# EasyEDA Pro project rp2040 control board.eprj, schematic Schematic1
Create Date: 2023-12-16; Page Name: P1; Project Name: New Project_2023-12-16_15-08-53; Schematic Name: Schematic1; Update Date: 2023-12-17; Company: 嘉立创EDA; Page Size: A4; Version: V1.0
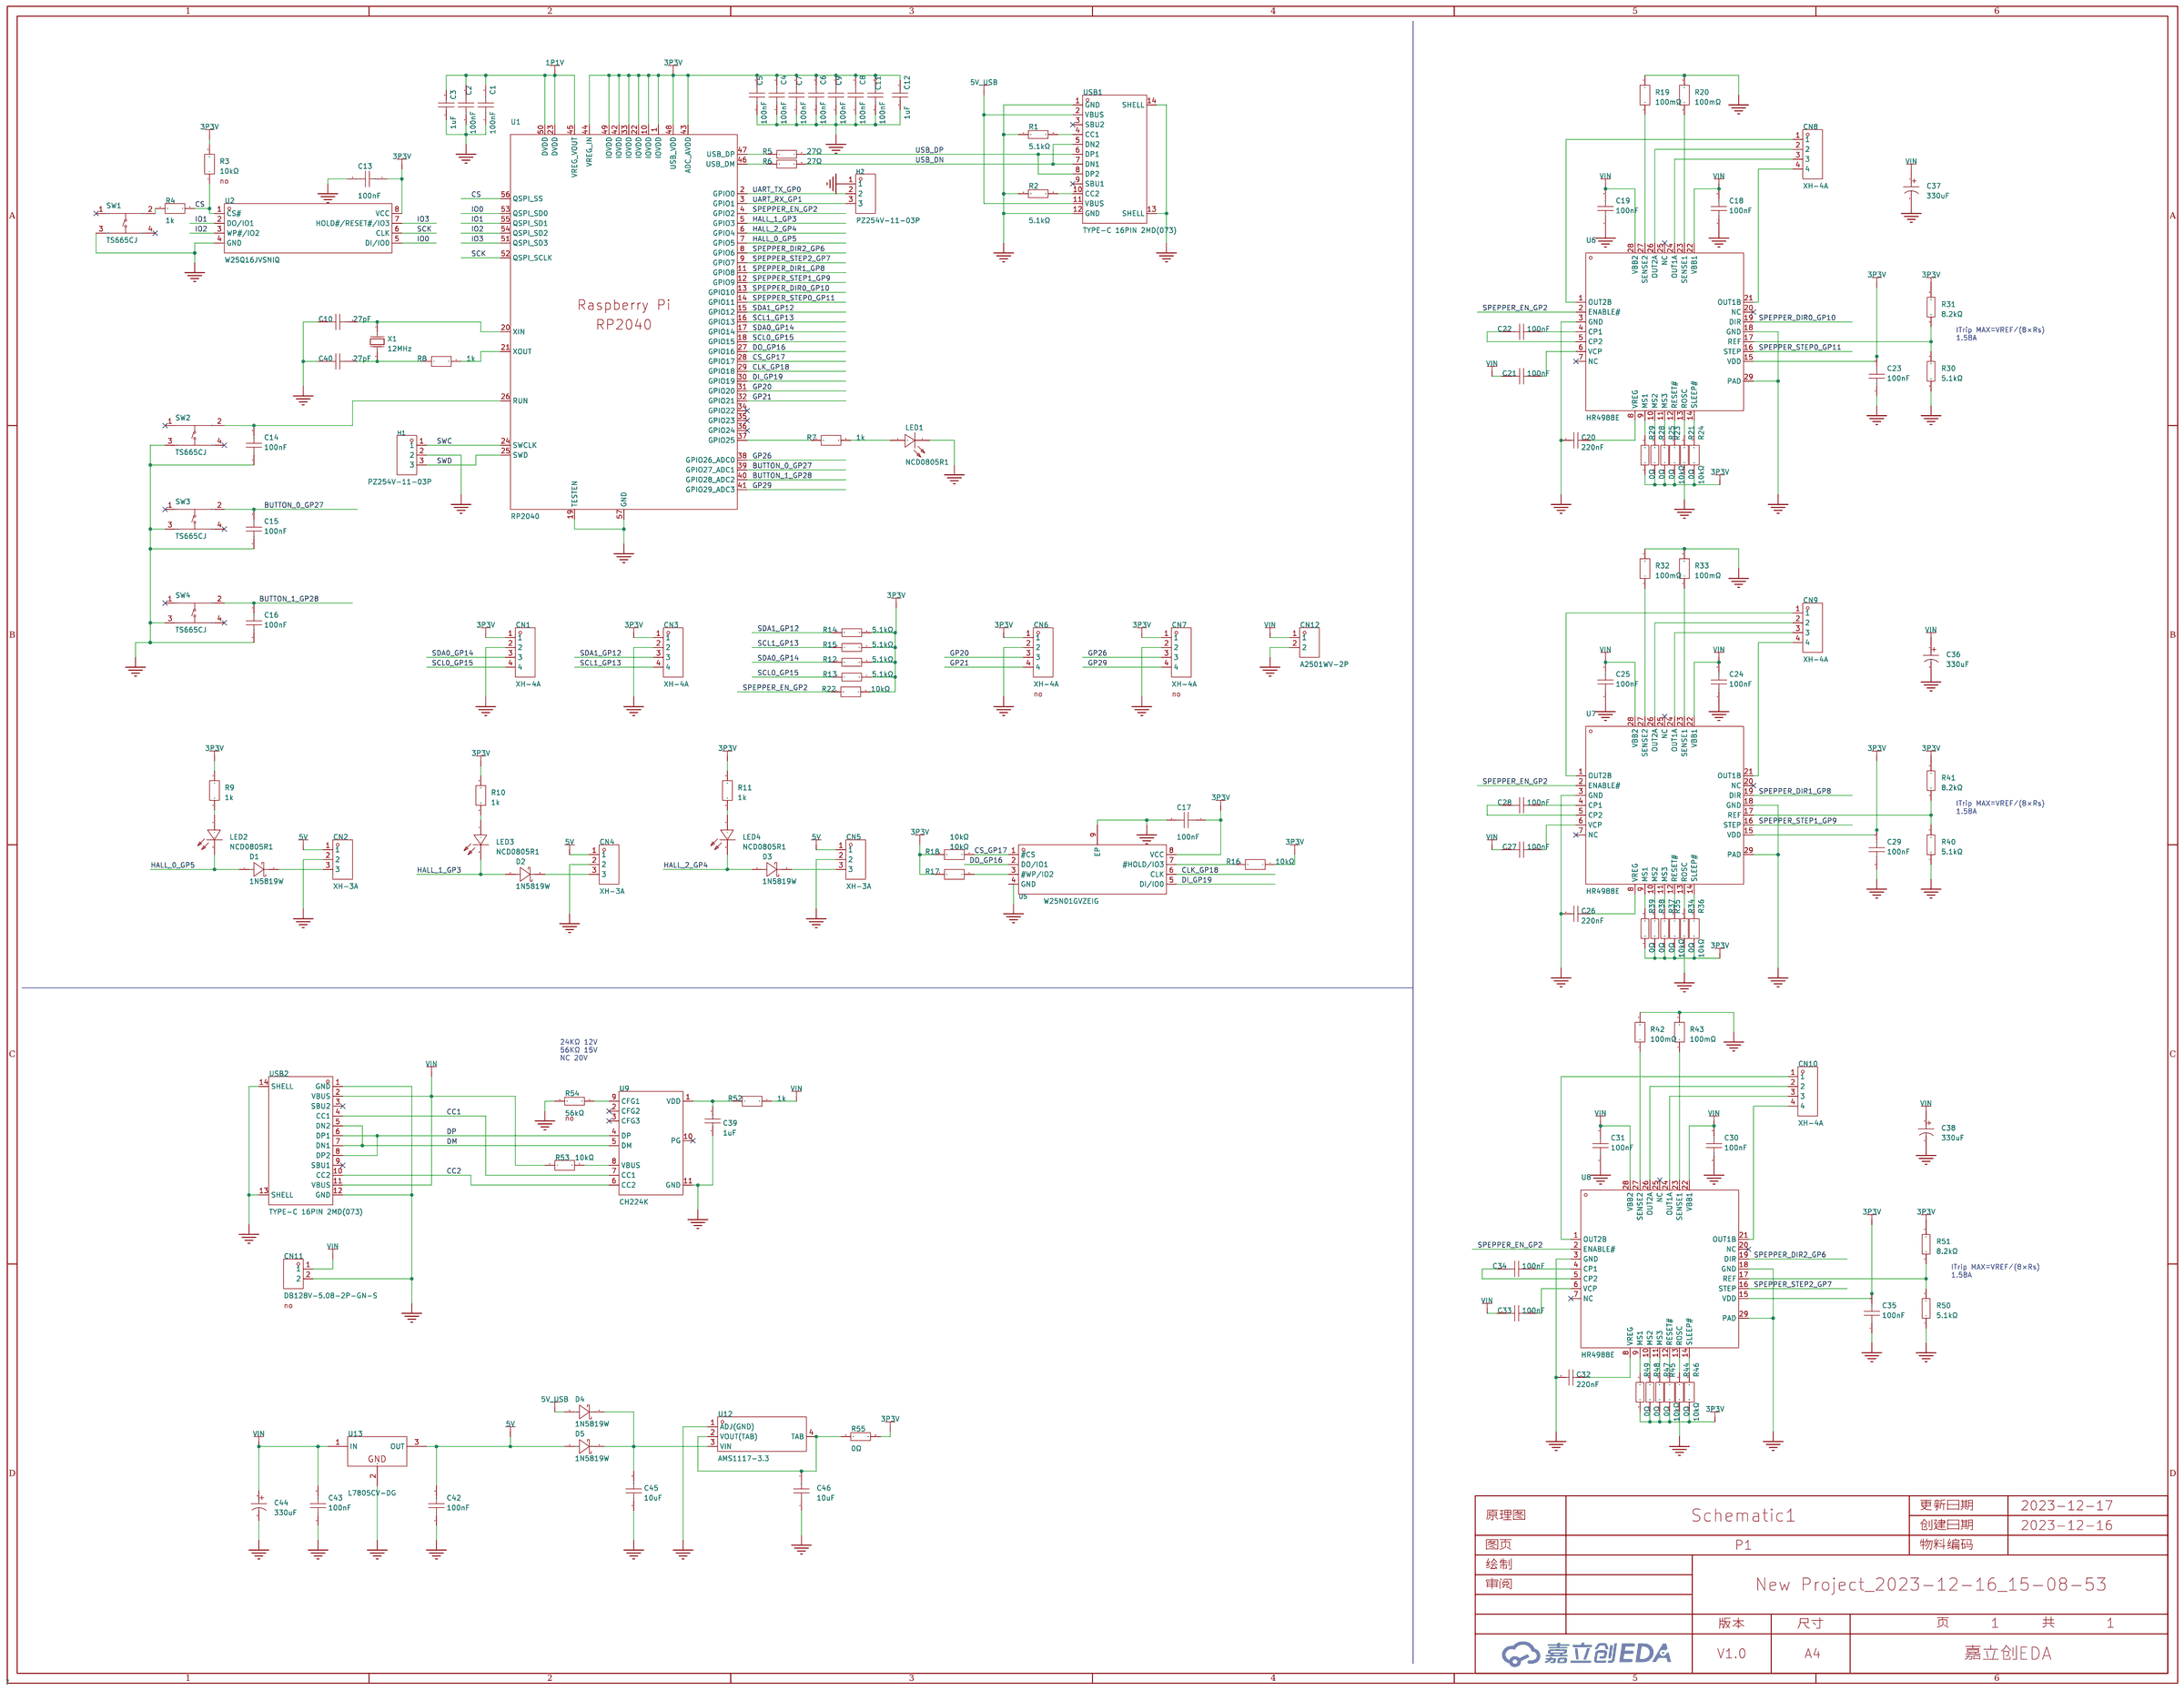
[diagram p0: schematic sheet]

## Parts
C1  100nF  [C0603]
C2  100nF  [C0603]
C3  1uF  [C0603]
C4  100nF  [C0603]
C5  100nF  [C0603]
C6  100nF  [C0603]
C7  100nF  [C0603]
C8  100nF  [C0603]
C9  100nF  [C0603]
C10  27pF  [C0603]
C11  100nF  [C0603]
C12  1uF  [C0603]
C13  100nF  [C0603]
C14  100nF  [C0603]
C15  100nF  [C0603]
C16  100nF  [C0603]
C17  100nF  [C0603]
C18  100nF  [C0603]
C19  100nF  [C0603]
C20  220nF  [C0603]
C21  100nF  [C0603]
C22  100nF  [C0603]
C23  100nF  [C0603]
C24  100nF  [C0603]
C25  100nF  [C0603]
C26  220nF  [C0603]
C27  100nF  [C0603]
C28  100nF  [C0603]
C29  100nF  [C0603]
C30  100nF  [C0603]
C31  100nF  [C0603]
C32  220nF  [C0603]
C33  100nF  [C0603]
C34  100nF  [C0603]
C35  100nF  [C0603]
C36  330uF  [CAP-TH_BD8.0-P3.50-D0.6-FD]
C37  330uF  [CAP-TH_BD8.0-P3.50-D0.6-FD]
C38  330uF  [CAP-TH_BD8.0-P3.50-D0.6-FD]
C39  1uF  [C0603]
C40  27pF  [C0603]
C42  100nF  [C0603]
C43  100nF  [C0603]
C44  330uF  [CAP-TH_BD8.0-P3.50-D0.6-FD]
C45  10uF  [C0603]
C46  10uF  [C0603]
CN1  XH-4A  [CONN-TH_XH2.50-4P]
CN2  XH-3A  [CONN-TH_XH-3A]
CN3  XH-4A  [CONN-TH_XH2.50-4P]
CN4  XH-3A  [CONN-TH_XH-3A]
CN5  XH-3A  [CONN-TH_XH-3A]
CN6  XH-4A  [CONN-TH_XH2.50-4P]  (no BOM)
CN7  XH-4A  [CONN-TH_XH2.50-4P]  (no BOM)
CN8  XH-4A  [CONN-TH_XH2.50-4P]
CN9  XH-4A  [CONN-TH_XH2.50-4P]
CN10  XH-4A  [CONN-TH_XH2.50-4P]
CN11  DB128V-5.08-2P-GN-S  [CONN-TH_2P-P5.08_DIBO_DB128V-5.08]  (no BOM)
CN12  A2501WV-2P  [CONN-TH_A2501WV-2P]
D1  1N5819W  [SOD-123_L2.7-W1.6-LS3.7-R-RD]
D2  1N5819W  [SOD-123_L2.7-W1.6-LS3.7-R-RD]
D3  1N5819W  [SOD-123_L2.7-W1.6-LS3.7-R-RD]
D4  1N5819W  [SOD-123_L2.7-W1.6-LS3.7-R-RD]
D5  1N5819W  [SOD-123_L2.7-W1.6-LS3.7-R-RD]
H1  PZ254V-11-03P  [HDR-TH_3P-P2.54-V-M]
H2  PZ254V-11-03P  [HDR-TH_3P-P2.54-V-M]
LED1  NCD0805R1  [LED0805-R-RD]
LED2  NCD0805R1  [LED0805-R-RD]
LED3  NCD0805R1  [LED0805-R-RD]
LED4  NCD0805R1  [LED0805-R-RD]
R1  5.1kΩ  [R0603]
R2  5.1kΩ  [R0603]
R3  10kΩ  [R0603]  (no BOM)
R4  1k  [R0603]
R5  27Ω  [R0603]
R6  27Ω  [R0603]
R7  1k  [R0603]
R8  1k  [R0603]
R9  1k  [R0603]
R10  1k  [R0603]
R11  1k  [R0603]
R12  5.1kΩ  [R0603]
R13  5.1kΩ  [R0603]
R14  5.1kΩ  [R0603]
R15  5.1kΩ  [R0603]
R16  10kΩ  [R0603]
R17  10kΩ  [R0603]
R18  10kΩ  [R0603]
R19  100mΩ  [R0805]
R20  100mΩ  [R0805]
R21  0Ω  [R0603]
R22  10kΩ  [R0603]
R23  10kΩ  [R0603]
R24  10kΩ  [R0603]
R25  0Ω  [R0603]
R28  0Ω  [R0603]
R29  0Ω  [R0603]
R30  5.1kΩ  [R0603]
R31  8.2kΩ  [R0603]
R32  100mΩ  [R0805]
R33  100mΩ  [R0805]
R34  0Ω  [R0603]
R35  10kΩ  [R0603]
R36  10kΩ  [R0603]
R37  0Ω  [R0603]
R38  0Ω  [R0603]
R39  0Ω  [R0603]
R40  5.1kΩ  [R0603]
R41  8.2kΩ  [R0603]
R42  100mΩ  [R0805]
R43  100mΩ  [R0805]
R44  0Ω  [R0603]
R45  10kΩ  [R0603]
R46  10kΩ  [R0603]
R47  0Ω  [R0603]
R48  0Ω  [R0603]
R49  0Ω  [R0603]
R50  5.1kΩ  [R0603]
R51  8.2kΩ  [R0603]
R52  1k  [R0603]
R53  10kΩ  [R0603]
R54  56kΩ  [R0603]  (no BOM)
R55  0Ω  [R0603]
SW1  TS665CJ  [SW-TH_4P-L6.0-W6.0-P4.50-LS6.5]
SW2  TS665CJ  [SW-TH_4P-L6.0-W6.0-P4.50-LS6.5]
SW3  TS665CJ  [SW-TH_4P-L6.0-W6.0-P4.50-LS6.5]
SW4  TS665CJ  [SW-TH_4P-L6.0-W6.0-P4.50-LS6.5]
U1  RP2040  [LQFN-56_L7.0-W7.0-P0.4-EP]
U2  W25Q16JVSNIQ  [SOP-8_L4.9-W3.9-P1.27-LS6.0-BL]
U5  W25N01GVZEIG  [WSON-8_L8.0-W6.10-P1.27-TL-EP]
U6  HR4988E  [QFN-28_L5.0-W5.0-P0.50-BL-EP3.3]
U7  HR4988E  [QFN-28_L5.0-W5.0-P0.50-BL-EP3.3]
U8  HR4988E  [QFN-28_L5.0-W5.0-P0.50-BL-EP3.3]
U9  CH224K  [ESSOP-10_L4.9-W3.9-P1.0-LS6.0-TL-EP]
U12  AMS1117-3.3  [SOT-223-4_L6.5-W3.5-P2.30-LS7.0-BR]
U13  L7805CV-DG  [TO-220-3_L10.0-W4.5-P2.54-L]
USB1  TYPE-C 16PIN 2MD(073)  [USB-C-SMD_TYPE-C-6PIN-2MD-073]
USB2  TYPE-C 16PIN 2MD(073)  [USB-C-SMD_TYPE-C-6PIN-2MD-073]
X1  12MHz  [HC-49US_L11.5-W4.5-P4.88]

## Library data of the parts
C1 C2 C4-C9 C11 C13-C19 C21-C25 C27-C31 C33-C35 C42 C43 = CC0603KRX7R9BB104: 容值:100nF;精度:±10%;额定电压:50V;材质(温度系数):X7R;; LCSC Part Name: 100nF ±10% 50V; Supplier Part: C14663; Manufacturer: YAGEO(国巨); Supplier Footprint: 0603; Datasheet: https://atta.szlcsc.com/upload/public/pdf/source/20180910/C282072_33301C7F631E79921B82A8DAC6BCC5B3.pdf; Supplier: LCSC; Tolerance: ±10%; Voltage Rated: 50V; Temperature Coefficient: X7R
C3 C12 C39 = CL10A105KB8NNNC: 容值:1uF;精度:±10%;额定电压:50V;材质(温度系数):X5R;; LCSC Part Name: 1uF ±10% 50V; Supplier Part: C15849; Manufacturer: SAMSUNG(三星); Supplier Footprint: 0603; Datasheet: https://atta.szlcsc.com/upload/public/pdf/source/20160218/1457707763339.pdf; Supplier: LCSC; Tolerance: ±10%; Voltage Rated: 50V; Temperature Coefficient: X5R
C10 C40 = CGA3E2C0G2A270J080AA: 容值:27pF;精度:±5%;额定电压:100V;材质(温度系数):C0G;; LCSC Part Name: 27pF ±5% 100V; Supplier Part: C3862781; Manufacturer: TDK; JLCPCB Part Class: 扩展库; Supplier: LCSC; Tolerance: ±5%; Voltage Rated: 100V; Temperature Coefficient: C0G
C20 C26 C32 = CL10B224KA8NNNC: 容值:220nF;精度:±10%;额定电压:25V;材质(温度系数):X7R;; LCSC Part Name: 220nF ±10% 25V; Supplier Part: C21120; Manufacturer: SAMSUNG(三星); Supplier Footprint: 0603; JLCPCB Part Class: 基础库; Datasheet: https://atta.szlcsc.com/upload/public/pdf/source/20160218/1457707763339.pdf; Supplier: LCSC; Tolerance: ±10%; Voltage Rated: 25V; Temperature Coefficient: X7R
C36-C38 C44 = 25ZLH330MEFC8X11.5: 容值:330uF;精度:±20%;额定电压:25V;纹波电流:945mA@100kHz;等效串联电阻:56mΩ@100kHz;; LCSC Part Name: 330uF ±20% 25V; Supplier Part: C109394; Manufacturer: rubycon(红宝石); Supplier Footprint: 插件,D8xL11.5mm; JLCPCB Part Class: 扩展库; Datasheet: https://atta.szlcsc.com/upload/public/pdf/source/20180704/C239301_0BE3E23B004BE37AFF30B8978A226056.pdf; Supplier: LCSC; Tolerance: ±20%; Rated Voltage: 25V; Ripple Current: 945mA@100kHz; Equivalent Series Resistance(ESR): 56mΩ@100kHz; Lead Spacing: 3.5mm; φD: 8mm; L: 11.5mm; Lifetime @ Temp: 8000hrs@105℃; Operating Temperature: -40℃~+105℃
C45 C46 = CL10A106KP8NNNC: 容值:10uF;精度:±10%;额定电压:10V;材质(温度系数):X5R;; LCSC Part Name: 10uF ±10% 10V; Supplier Part: C19702; Manufacturer: SAMSUNG(三星); Supplier Footprint: 0603; JLCPCB Part Class: 基础库; Datasheet: https://atta.szlcsc.com/upload/public/pdf/source/20160218/1457707763339.pdf; Supplier: LCSC; Tolerance: ±10%; Voltage Rated: 10V; Temperature Coefficient: X5R
CN1 CN3 CN6-CN10 = XH-4A_C2908602: 插针结构:1x4P;间距:2.5mm;安装方式:直插;行距:-;总PIN数:4P;排数:1;每排PIN数:4;参考系列:XH;额定电流:3A;工作温度范围:-25℃~+85℃;; LCSC Part Name: 1x4P 间距:2.5mm 直插 系列:XH; Supplier Part: C2908602; Manufacturer: HCTL(华灿天禄); Supplier Footprint: 插件,P=2.5mm; JLCPCB Part Class: 扩展库; Datasheet: https://atta.szlcsc.com/upload/public/pdf/source/20230711/68D365716984B4AFE576D1D73D61B465.pdf; Supplier: LCSC; Pins Structure: 1x4P; Pitch: 2.5mm; Mounting Style: 直插; Number of Pins: 4P; Number of Rows: 1; Number of PINs Per Row: 4; Reference Series: XH; Current Rating (Max): 3A; Operating Temperature Range: -25℃~+85℃
CN2 CN4 CN5 = XH-3A: 插针结构:1x3P;间距:2.5mm;安装方式:直插;行距:-;总PIN数:3P;排数:1;每排PIN数:3;参考系列:XH;额定电流:3A;工作温度范围:-25℃~+85℃;; LCSC Part Name: 1x3P 间距:2.5mm 直插 系列:XH; Supplier Part: C2908601; Manufacturer: HCTL(华灿天禄); Supplier Footprint: 插件,P=2.5mm; JLCPCB Part Class: Extended Part; Datasheet: https://atta.szlcsc.com/upload/public/pdf/source/20230711/68D365716984B4AFE576D1D73D61B465.pdf; Supplier: LCSC; Pins Structure: 1x3P; Pitch: 2.5mm; Mounting Style: 直插; Number of Pins: 3P; Number of Rows: 1; Number of PINs Per Row: 3; Reference Series: XH; Current Rating (Max): 3A; Operating Temperature Range: -25℃~+85℃
CN11 = DB128V-5.08-2P-GN-S: 间距:5.08mm;结构:1x2P;安装方式:直插;排数:1;额定电流:20A;额定电压:300V;线规 - AWG:12~30;线规 - mm2:2.5;工作温度范围:-40℃~+105℃;颜色:绿色;每排PIN数:2;; LCSC Part Name: 5.08mm 1x2P 排数:1 每排P数:2 直插 铜; Supplier Part: C2915639; Manufacturer: DORABO(地博电气); Supplier Footprint: 插件,P=5.08mm; JLCPCB Part Class: 扩展库; Datasheet: https://atta.szlcsc.com/upload/public/pdf/source/20230106/CC449C10514519CDCE20F1C37DBF2DAC.pdf; Supplier: LCSC; Pitch: 5.08mm; Structure: 1x2P; Mounting Style: 直插; Number of Pins: 2P; Number of Rows: 1; Current Rating (Max): 20A; Voltage Rating (Max): 300V; Wire Gauge - AWG: 12~30; Wire Gauge - mm2: 2.5; Operating Temperature Range: -40℃~+105℃; Color: 绿色; Number of PINs Per Row: 2
CN12 = A2501WV-2P: 插针结构:1x2P;间距:2.5mm;安装方式:-;行距:-;总PIN数:2P;排数:1;每排PIN数:2;参考系列:XH;触头材质:黄铜;; LCSC Part Name: 1x2P 间距:2.5mm 系列:XH 直插 镀锡; Supplier Part: C225388; Manufacturer: CJT(长江连接器); Supplier Footprint: 插件,P=2.5mm; JLCPCB Part Class: 扩展库; Datasheet: https://atta.szlcsc.com/upload/public/pdf/source/20190911/C273207_AE7733CA28D6B2C9AC656CEED013742F.pdf; Supplier: LCSC; Pins Structure: 1x2P; Pitch: 2.5mm; Number of Pins: 2P; Number of Rows: 1; Number of PINs Per Row: 2; Reference Series: XH; Contact Material: 黄铜
D1-D5 = 1N5819W_C963381: 二极管配置:独立式;正向压降(Vf):600mV@200mA;直流反向耐压(Vr):40V;平均整流电流(Io):350mA;; LCSC Part Name: 电压:40V 电流:350mA; Supplier Part: C963381; Manufacturer: JSMSEMI(杰盛微); Supplier Footprint: SOD-123; JLCPCB Part Class: 扩展库; Datasheet: https://atta.szlcsc.com/upload/public/pdf/source/20230807/ADD53622154D5B572F84A7B877E922CE.pdf; Supplier: LCSC; Diode Configuration: 独立式; Forward Voltage (Vf@If): 600mV@200mA; Reverse Voltage (Vr): 40V; Average Rectified Current (Io): 350mA; Reverse Leakage Current (Ir): 5uA@30V
H1 H2 = PZ254V-11-03P: 排数:单排;总PIN位数:3;间距:2.54mm;插针结构:1x3P;行距:-;安装类型:直插;圆针/方针:方针;额定电流:3A;额定电压:250V;配合针长度:6mm;塑高:2.5mm;端接针长度:3mm;工作温度范围:-40℃~+105℃;颜色:黑色;; LCSC Part Name: 2.54mm 1x3P 直插 方针; Supplier Part: C2937625; Manufacturer: XFCN(兴飞); Supplier Footprint: 直插,P=2.54mm; JLCPCB Part Class: 扩展库; Datasheet: 2022-07-12/581362A/62b9d00620994b3696be7eb4af85ad72/双排排针和单排排针.pdf; Supplier: LCSC; Number of Rows: 单排; Number of Pins: 3; Pitch: 2.54mm; Pin Structure: 1x3P; Mounting Type: 直插; Circluar Pins/Square Pins: 方针; Current Rating (Max): 3A; Voltage Rating (Max): 250V; Length of Mating Pin: 6mm; Insulation Height: 2.5mm; Length of End Connection Pin: 3mm; Operating Temperature Range: -40℃~+105℃; Color: 黑色
LED1-LED4 = NCD0805R1: 发光颜色:红色;二极管配置:-;功率:65mW;透镜颜色:无色透明;主波长:615nm~630nm;色温:-;发光强度:67mcd~195mcd;发光角度:130°;安装方式:-;工作温度:-30℃~+85℃;; LCSC Part Name: 红灯 0805红灯   正贴; Supplier Part: C84256; Manufacturer: 国星光电; Supplier Footprint: 0805; JLCPCB Part Class: 基础库; Datasheet: https://atta.szlcsc.com/upload/public/pdf/source/20200820/C84256_F0A75A43B3EAD75808600A0514C76B99.pdf; Supplier: LCSC; Emitted Color: 红色; Forward Voltage (VF): 1.6V~2.6V; Forward Current: 20mA; Power Dissipation: 65mW; Lens Color: 无色透明; Dominant Wavelength: 615nm~630nm; Luminous Intensity: 67mcd~195mcd; Viewing Angle: 130°; Operating Temperature: -30℃~+85℃
R1 R2 R12-R15 R30 R40 R50 = 0603WAF5101T5E: 阻值:5.1kΩ;精度:±1%;功率:100mW;温度系数:±100ppm/℃;电阻类型:厚膜电阻;; LCSC Part Name: 5.1kΩ ±1% 100mW 厚膜电阻; Supplier Part: C23186; Manufacturer: UNI-ROYAL(厚声); Supplier Footprint: 0603; Datasheet: https://atta.szlcsc.com/upload/public/pdf/source/20200306/C422600_1E6D84923E4A46A82E41ADD87F860B5C.pdf; Supplier: LCSC; Tolerance: ±1%; Power(Watts): 100mW; Overload Voltage (Max): 75V; Temperature Coefficient: ±100ppm/℃; Type: 厚膜电阻; Operating Temperature Range: -55℃~+155℃
R3 R16-R18 R22-R24 R35 R36 R45 R46 R53 = AT0603BRD0710KL: 电阻类型:薄膜电阻;阻值:10kΩ;精度:±0.1%;功率:100mW;; LCSC Part Name: 10kΩ ±0.1% 100mW; Supplier Part: C723396; Manufacturer: YAGEO(国巨); Supplier Footprint: 0603; JLCPCB Part Class: 扩展库; Datasheet: https://atta.szlcsc.com/upload/public/pdf/source/20200722/C705051_EA338A836C78FCD1C867566BE6F43B3A.pdf; Supplier: LCSC; Type: 薄膜电阻; Tolerance: ±0.1%; Power(Watts): 100mW; Temperature Coefficient: ±25ppm/℃; Overload Voltage (Max): 75V; Operating Temperature Range: -55℃~+155℃
R4 R7-R11 R52 = 1k: Supplier Part: C9900012840; JLCPCB Part Class: 扩展库; Supplier: LCSC
R5 R6 = RS-03K27R0FT: 精度:±1%;温度系数:±100ppm/℃;阻值:27Ω;功率:100mW;最大工作电压:50V;工作温度范围:-55℃~+155℃;; LCSC Part Name: 27.0Ω(27R0) ±1%; Supplier Part: C321830; Manufacturer: FH(风华); Supplier Footprint: 0603; JLCPCB Part Class: 扩展库; Datasheet: https://atta.szlcsc.com/upload/public/pdf/source/20181120/C321830_E77A57045CE9A79D257E73FE3C106617.pdf; Supplier: LCSC; Tolerance: ±1%; Temperature Coefficient: ±100ppm/℃; Power(Watts): 100mW; Overload Voltage (Max): 50V; Operating Temperature Range: -55℃~+155℃
R19 R20 R32 R33 R42 R43 = CR0805J0R1P05: 电阻类型:厚膜电阻;阻值:100mΩ;精度:±5%;功率:125mW;; LCSC Part Name: 100mΩ ±5% 125mW; Supplier Part: C429643; Manufacturer: EVER OHMS(天二科技); Supplier Footprint: 0805; JLCPCB Part Class: 扩展库; Datasheet: https://atta.szlcsc.com/upload/public/pdf/source/20190918/C429643_B0DBD6D3E4412DC6138E94FA6C8BEFE1.pdf; Supplier: LCSC; Type: 厚膜电阻; Tolerance: ±5%; Power(Watts): 125mW; Temperature Coefficient: ±800ppm/℃; Overload Voltage (Max): 150V; Operating Temperature Range: -55℃~+155℃
R21 R25 R28 R29 R34 R37-R39 R44 R47-R49 R55 = 0603WAF0000T5E: 阻值:0Ω;精度:±1%;功率:100mW;电阻类型:厚膜电阻;; LCSC Part Name: 0Ω ±1% 100mW 厚膜电阻; Supplier Part: C21189; Manufacturer: UNI-ROYAL(厚声); Supplier Footprint: 0603; JLCPCB Part Class: 基础库; Datasheet: https://atta.szlcsc.com/upload/public/pdf/source/20200306/C422600_1E6D84923E4A46A82E41ADD87F860B5C.pdf; Supplier: LCSC; Tolerance: ±1%; Power(Watts): 100mW; Overload Voltage (Max): 75V; Type: 厚膜电阻; Operating Temperature Range: -55℃~+155℃
R31 R41 R51 = 0603WAF8201T5E: 阻值:8.2kΩ;精度:±1%;功率:100mW;温度系数:±100ppm/℃;电阻类型:厚膜电阻;; LCSC Part Name: 8.2kΩ ±1% 100mW 厚膜电阻; Supplier Part: C25981; Manufacturer: UNI-ROYAL(厚声); Supplier Footprint: 0603; Datasheet: https://atta.szlcsc.com/upload/public/pdf/source/20200306/C422600_1E6D84923E4A46A82E41ADD87F860B5C.pdf; Supplier: LCSC; Tolerance: ±1%; Power(Watts): 100mW; Overload Voltage (Max): 75V; Temperature Coefficient: ±100ppm/℃; Type: 厚膜电阻; Operating Temperature Range: -55℃~+155℃
R54 = 0603WAF5602T5E: 阻值:56kΩ;精度:±1%;功率:100mW;温度系数:±100ppm/℃;电阻类型:厚膜电阻;; LCSC Part Name: 56kΩ ±1% 100mW 厚膜电阻; Supplier Part: C23206; Manufacturer: UNI-ROYAL(厚声); Supplier Footprint: 0603; JLCPCB Part Class: 基础库; Datasheet: https://atta.szlcsc.com/upload/public/pdf/source/20200306/C422600_1E6D84923E4A46A82E41ADD87F860B5C.pdf; Supplier: LCSC; Tolerance: ±1%; Power(Watts): 100mW; Overload Voltage (Max): 75V; Temperature Coefficient: ±100ppm/℃; Type: 厚膜电阻; Operating Temperature Range: -55℃~+155℃
SW1-SW4 = TS665CJ: 触点电流:50mA;额定电压(DC):12V;电路结构:单刀单掷;安装方式:直插;带灯:-;机械寿命:-;; LCSC Part Name: 6*6*5mm 直插 轻触开关; Supplier Part: C393938; Manufacturer: SHOU HAN(首韩); Supplier Footprint: 插件; JLCPCB Part Class: 扩展库; Datasheet: https://atta.szlcsc.com/upload/public/pdf/source/20190521/C393938_BDABEAC600B4C55E200A80AA129B70BC.pdf; Supplier: LCSC; Contact Current: 50mA; Voltage Rating (DC): 12V; Circuit: 单刀单掷; Mounting Style: 直插; Actuator Style: 圆形按钮; Switch Length: 6mm; Switch Width: 6mm; Switch Height: 5mm
U1 = RP2040_C2040: CPU内核:ARM-M系列;CPU最大主频:133MHz;程序存储容量:-;程序存储器类型:-;GPIO端口数量:30;工作电压范围:-;RAM总容量:264KB;应用领域:-;; Supplier Part: C2040; Manufacturer: Raspberry Pi(树莓派); Supplier Footprint: LQFN-56(7x7); Datasheet: https://atta.szlcsc.com/upload/public/pdf/source/20210621/C2040_96F425825606B7957D87DD32E2512CA9.pdf; Supplier: LCSC; CPU Core: ARM-M系列; CPU Maximum Speed: 133MHz; GPIO Ports Number: 30; RAM Size: 264KB; ADC (Bit): 12bit; UART/USART: 2; I2C: 2; SPI: 2; Universal Serial Bus: 有; Peripheral/Function: DMA；PWM; Direct Memory Access: 有
U2 = W25Q16JVSNIQ_C2456211: Supplier Part: C2456211; Manufacturer: WINBOND(华邦); Supplier Footprint: SOP-8; JLCPCB Part Class: 扩展库; Datasheet: https://atta.szlcsc.com/upload/public/pdf/source/20190529/C115407_78E5B4F96E7138D299EC51EC5982A1A5.pdf; Supplier: LCSC
U5 = W25N01GVZEIG_C88868: 1-Gbit(128M x 8bit)，SPI接口，工作电压：2.7V to 3.6V; Supplier Part: C88868; Manufacturer: WINBOND(华邦); Supplier Footprint: WSON-8-EP(6.1x8); JLCPCB Part Class: 扩展库; Datasheet: https://atta.szlcsc.com/upload/public/pdf/source/20180428/C88868_D3C946FD371B1278FED16ED9DB2A4B79.pdf; Supplier: LCSC
U6-U8 = HR4988E: 步进电机驱动芯片; Supplier Part: C128662; Manufacturer: 嘉兴禾润; Supplier Footprint: QFN-28; JLCPCB Part Class: 扩展库; Datasheet: https://atta.szlcsc.com/upload/public/pdf/source/20220524/FFDFC22DD183A5C64A980C6813D09A70.pdf; Supplier: LCSC
U9 = CH224K: 应用功能:USB充电芯片;; LCSC Part Name: USB PD等多快充协议受电芯片CH224; Supplier Part: C970725; Manufacturer: WCH(南京沁恒); Supplier Footprint: ESSOP-10; JLCPCB Part Class: 扩展库; Datasheet: https://atta.szlcsc.com/upload/public/pdf/source/20220425/5F3B4646B9AC793D88468BCB08421765.pdf; Supplier: LCSC; Applications Function: USB充电芯片
U12 = AMS1117-3.3_C347222: 输出类型:固定;最大输入电压:18V;输出电压:3.3V;输出电流:1A;电源纹波抑制比(PSRR):60dB@(120Hz);输出极性:正;; LCSC Part Name: 输入18V 输出3.3V 1A; Supplier Part: C347222; Manufacturer: UMW(友台半导体); Supplier Footprint: SOT-223; JLCPCB Part Class: 扩展库; Datasheet: https://atta.szlcsc.com/upload/public/pdf/source/20231109/155D79A26D9DB04352555A58D5969DC8.pdf; Supplier: LCSC; Output Type: 固定; Maximum Input Voltage: 18V; Output Voltage: 3.3V; Output Current: 1A; Power Supply Rejection Ratio (PSRR): 60dB@(120Hz); Dropout Voltage: 1.3V@(1A); Output Polarity: 正; Number of Outputs: 1
U13 = L7805CV-DG: 输出类型:固定;输出极性:正;最大输入电压:35V;输出电压:5V;输出电流:1.5A;电源纹波抑制比(PSRR):62dB@(120Hz);; LCSC Part Name: 输入35V 输出5V 1.5A 厚散热片厚度1.3mm; Supplier Part: C3795; Manufacturer: ST(意法半导体); Supplier Footprint: TO-220; JLCPCB Part Class: 扩展库; Datasheet: https://atta.szlcsc.com/upload/public/pdf/source/20140724/1457707163191.pdf; Supplier: LCSC; Output Type: 固定; Output Polarity: 正; Number of Outputs: 1; Maximum Input Voltage: 35V; Output Voltage: 5V; Dropout Voltage: 2V@(1A); Output Current: 1.5A; Power Supply Rejection Ratio (PSRR): 62dB@(120Hz)
USB1 USB2 = TYPE-C 16PIN 2MD(073): 连接器类型:Type-C;标准:-;公母:母;触点数量:16P;端口数量:1;安装方式:卧贴;额定电流 - 电源:5A;工作温度范围:-25℃~+85℃;; LCSC Part Name: Type-C 母 卧贴 带定位柱 不锈钢外壳 2次模顶; Supplier Part: C2765186; Manufacturer: SHOU HAN(首韩); Supplier Footprint: SMD; JLCPCB Part Class: 扩展库; Datasheet: https://atta.szlcsc.com/upload/public/pdf/source/20211123/39B17C16241EAC15C5E277BDA434118E.pdf; Supplier: LCSC; Connector Type: Type-C; Gender: 母; Number of Contacts: 16P; Number of Ports: 1; Mounting Style: 卧贴; Current Rating - Power (Max): 5A; Operating Temperature Range: -25℃~+85℃
X1 = X49SD12MSD2SC: 频率:12MHz;负载电容:20pF;频率公差:±20ppm;; LCSC Part Name: 12MHz ±20ppm 20pF HC-49US; Supplier Part: C16369; Manufacturer: YXC(扬兴晶振); Supplier Footprint: HC-49S; JLCPCB Part Class: 扩展库; Datasheet: https://atta.szlcsc.com/upload/public/pdf/source/20210903/A997D130AE99CBB55D9024F9BE6DA174.pdf; Supplier: LCSC; Crystal Type: 49S晶振; Load Capacitance: 20pF; Frequency Tolerance: ±20ppm; Frequency Stability: ±30ppm; Operating Temperature: -20℃~+70℃

## Nets
5V: C42.2 CN2.1 CN4.1 CN5.1 D5.1(A) U13.3(OUT)
5V_USB: D4.1(A) USB1.2(VBUS) USB1.11(VBUS)
GND: C1.1 C2.1 C3.1 C4.1 C5.1 C6.1 C7.1 C8.1 C9.1 C10.1 C11.1 C12.1 C13.2 C14.1 C15.1 C16.1 C17.2 C18.1 C19.1 C20.2 C23.1 C24.1 C25.1 C26.2 C29.1 C30.1 C31.1 C32.2 C35.1 C36.2 C37.2 C38.2 C39.1 C40.1 C42.1 C43.1 C44.2 C45.1 C46.1 CN1.2 CN2.2 CN3.2 CN4.2 CN5.2 CN6.2 CN7.2 CN11.2 CN12.2 H1.2 H2.1 LED1.2(-) R1.1 R2.1 R19.2 R20.2 R21.1 R30.1 R32.2 R33.2 R34.1 R40.1 R42.2 R43.2 R44.1 R50.1 R54.1 SW1.3(C) SW2.3(C) SW3.3(C) SW4.3(C) U1.19(TESTEN) U1.57(GND) U2.4(GND) U5.4(GND) U5.9(EP) U6.3(GND) U6.18(GND) U6.29(PAD) U7.3(GND) U7.18(GND) U7.29(PAD) U8.3(GND) U8.18(GND) U8.29(PAD) U9.11(GND) U12.1(ADJ(GND)) U13.2(GND) USB1.1(GND) USB1.12(GND) USB1.13(SHELL) USB1.14(SHELL) USB2.1(GND) USB2.12(GND) USB2.13(SHELL) USB2.14(SHELL)
VIN: C18.2 C19.2 C21.2 C24.2 C25.2 C27.2 C30.2 C31.2 C33.2 C36.1 C37.1 C38.1 C43.2 C44.1 CN11.1 CN12.1 R52.2 R53.1 U6.22(VBB1) U6.28(VBB2) U7.22(VBB1) U7.28(VBB2) U8.22(VBB1) U8.28(VBB2) U13.1(IN) USB2.2(VBUS) USB2.11(VBUS)
1P1V: C1.2 C2.2 C3.2 U1.23(DVDD) U1.45(VREG_VOUT) U1.50(DVDD)
3P3V: C4.2 C5.2 C6.2 C7.2 C8.2 C9.2 C11.2 C12.2 C13.1 C17.1 C23.2 C29.2 C35.2 CN1.1 CN3.1 CN6.1 CN7.1 R3.2 R9.1 R10.1 R11.1 R12.2 R13.2 R14.2 R15.2 R16.1 R17.2 R18.2 R22.1 R23.2 R24.2 R25.1 R28.1 R29.1 R31.2 R35.2 R36.2 R37.1 R38.1 R39.1 R41.2 R45.2 R46.2 R47.1 R48.1 R49.1 R51.2 R55.2 U1.1(IOVDD) U1.10(IOVDD) U1.22(IOVDD) U1.33(IOVDD) U1.42(IOVDD) U1.43(ADC_AVDD) U1.44(VREG_IN) U1.48(USB_VDD) U1.49(IOVDD) U2.8(VCC) U5.8(VCC) U6.15(VDD) U7.15(VDD) U8.15(VDD)
BUTTON_0_GP27: C15.2 SW3.2(B) U1.39(GPIO27_ADC1)
BUTTON_1_GP28: C16.2 SW4.2(B) U1.40(GPIO28_ADC2)
CC1: U9.7(CC1) USB2.4(CC1)
CC2: U9.6(CC2) USB2.10(CC2)
CLK_GP18: U1.29(GPIO18) U5.6(CLK)
CS: R3.1 R4.2 U1.56(QSPI_SS) U2.1(CS#)
CS_GP17: R18.1 U1.28(GPIO17) U5.1(#CS)
DI_GP19: U1.30(GPIO19) U5.5(DI/IO0)
DM: U9.5(DM) USB2.5(DN2) USB2.7(DN1)
DO_GP16: U1.27(GPIO16) U5.2(DO/IO1)
DP: U9.4(DP) USB2.6(DP1) USB2.8(DP2)
GP20: CN6.3 U1.31(GPIO20)
GP21: CN6.4 U1.32(GPIO21)
GP26: CN7.3 U1.38(GPIO26_ADC0)
GP29: CN7.4 U1.41(GPIO29_ADC3)
HALL_0_GP5: D1.1(A) LED2.2(-) U1.7(GPIO5)
HALL_1_GP3: D2.1(A) LED3.2(-) U1.5(GPIO3)
HALL_2_GP4: D3.1(A) LED4.2(-) U1.6(GPIO4)
IO0: U1.53(QSPI_SD0) U2.5(DI/IO0)
IO1: U1.55(QSPI_SD1) U2.2(DO/IO1)
IO2: U1.54(QSPI_SD2) U2.3(WP#/IO2)
IO3: U1.51(QSPI_SD3) U2.7(HOLD#/RESET#/IO3)
SCK: U1.52(QSPI_SCLK) U2.6(CLK)
SCL0_GP15: CN1.4 R13.1 U1.18(GPIO15)
SCL1_GP13: CN3.4 R15.1 U1.16(GPIO13)
SDA0_GP14: CN1.3 R12.1 U1.17(GPIO14)
SDA1_GP12: CN3.3 R14.1 U1.15(GPIO12)
SPEPPER_DIR0_GP10: U1.13(GPIO10) U6.19(DIR)
SPEPPER_DIR1_GP8: U1.11(GPIO8) U7.19(DIR)
SPEPPER_DIR2_GP6: U1.8(GPIO6) U8.19(DIR)
SPEPPER_EN_GP2: R22.2 U1.4(GPIO2) U6.2(ENABLE#) U7.2(ENABLE#) U8.2(ENABLE#)
SPEPPER_STEP0_GP11: U1.14(GPIO11) U6.16(STEP)
SPEPPER_STEP1_GP9: U1.12(GPIO9) U7.16(STEP)
SPEPPER_STEP2_GP7: U1.9(GPIO7) U8.16(STEP)
SWC: H1.1 U1.24(SWCLK)
SWD: H1.3 U1.25(SWD)
UART_RX_GP1: H2.3 U1.3(GPIO1)
UART_TX_GP0: H2.2 U1.2(GPIO0)
USB_DN: R6.2 USB1.5(DN2) USB1.7(DN1)
USB_DP: R5.2 USB1.6(DP1) USB1.8(DP2)
$1N2562: R2.2 USB1.10(CC2)
$1N2575: R1.2 USB1.4(CC1)
$1N3573: R4.1 SW1.2(B)
$1N3808: C10.2 U1.20(XIN) X1.1(OSC1)
$1N3926: R5.1 U1.47(USB_DP)
$1N3985: R6.1 U1.46(USB_DM)
$1N4134: LED1.1(+) R7.2
$1N4138: R7.1 U1.37(GPIO25)
$1N4190: R8.2 U1.21(XOUT)
$1N4191: C40.2 R8.1 X1.2(OSC2)
$1N4368: C14.2 SW2.2(B) U1.26(RUN)
$1N5423: CN2.3 D1.2(C)
$1N5501: LED2.1(+) R9.2
$1N6132: CN4.3 D2.2(C)
$1N6134: LED3.1(+) R10.2
$1N6333: CN5.3 D3.2(C)
$1N6335: LED4.1(+) R11.2
$1N7156: R16.2 U5.7(#HOLD/IO3)
$1N7164: R17.1 U5.3(#WP/IO2)
$1N7578: R20.1 U6.23(SENSE1)
$1N7584: R19.1 U6.27(SENSE2)
$1N7659: R21.2 U6.13(ROSC)
$1N8001: CN8.2 U6.26(OUT2A)
$1N8005: CN8.3 U6.24(OUT1A)
$1N8055: CN8.4 U6.21(OUT1B)
$1N8060: CN8.1 U6.1(OUT2B)
$1N8394: C20.1 U6.8(VREG)
$1N8530: R24.1 U6.14(SLEEP#)
$1N8575: R23.1 U6.12(RESET#)
$1N8768: R28.2 U6.10(MS2)
$1N8771: R25.2 U6.11(MS3)
$1N8774: R29.2 U6.9(MS1)
$1N8956: C21.1 U6.6(VCP)
$1N9009: C22.1 U6.4(CP1)
$1N9012: C22.2 U6.5(CP2)
$1N9237: R30.2 R31.1 U6.17(REF)
$1N16840: R33.1 U7.23(SENSE1)
$1N16841: R32.1 U7.27(SENSE2)
$1N16842: R34.2 U7.13(ROSC)
$1N16845: CN9.2 U7.26(OUT2A)
$1N16846: CN9.3 U7.24(OUT1A)
$1N16847: CN9.4 U7.21(OUT1B)
$1N16848: CN9.1 U7.1(OUT2B)
$1N16854: C26.1 U7.8(VREG)
$1N16857: R36.1 U7.14(SLEEP#)
$1N16858: R35.1 U7.12(RESET#)
$1N16860: R38.2 U7.10(MS2)
$1N16861: R37.2 U7.11(MS3)
$1N16862: R39.2 U7.9(MS1)
$1N16864: C27.1 U7.6(VCP)
$1N16865: C28.1 U7.4(CP1)
$1N16866: C28.2 U7.5(CP2)
$1N16871: R40.2 R41.1 U7.17(REF)
$1N17771: R43.1 U8.23(SENSE1)
$1N17772: R42.1 U8.27(SENSE2)
$1N17773: R44.2 U8.13(ROSC)
$1N17776: CN10.2 U8.26(OUT2A)
$1N17777: CN10.3 U8.24(OUT1A)
$1N17778: CN10.4 U8.21(OUT1B)
$1N17779: CN10.1 U8.1(OUT2B)
$1N17785: C32.1 U8.8(VREG)
$1N17788: R46.1 U8.14(SLEEP#)
$1N17789: R45.1 U8.12(RESET#)
$1N17791: R48.2 U8.10(MS2)
$1N17792: R47.2 U8.11(MS3)
$1N17793: R49.2 U8.9(MS1)
$1N17795: C33.1 U8.6(VCP)
$1N17796: C34.1 U8.4(CP1)
$1N17797: C34.2 U8.5(CP2)
$1N17802: R50.2 R51.1 U8.17(REF)
$1N19773: R54.2 U9.9(CFG1)
$1N19809: R53.2 U9.8(VBUS)
$1N19847: C39.2 R52.1 U9.1(VDD)
$1N21001: C46.2 R55.1 U12.2(VOUT(TAB)) U12.4(TAB)
$1N29145: C45.2 D4.2(C) D5.2(C) U12.3(VIN)

Not connected (* = marked no-connect by the designer): SW1 1(A)* 4(D)*; SW2 1(A)* 4(D)*; SW3 1(A)* 4(D)*; SW4 1(A)* 4(D)*; U1 34(GPIO22)* 35(GPIO23)* 36(GPIO24)*; U6 7(NC)* 20(NC)* 25(NC)*; U7 7(NC)* 20(NC)* 25(NC)*; U8 7(NC)* 20(NC)* 25(NC)*; U9 2(CFG2)* 3(CFG3)* 10(PG)*; USB1 3(SBU2)* 9(SBU1)*; USB2 3(SBU2)* 9(SBU1)*

## Notes on the sheet
- ITrip MAX＝VREF／(8×Rs)
  1.58A
- ITrip MAX＝VREF／(8×Rs)
  1.58A
- 24KΩ 12V
  56KΩ 15V
  NC 20V
- ITrip MAX＝VREF／(8×Rs)
  1.58A
